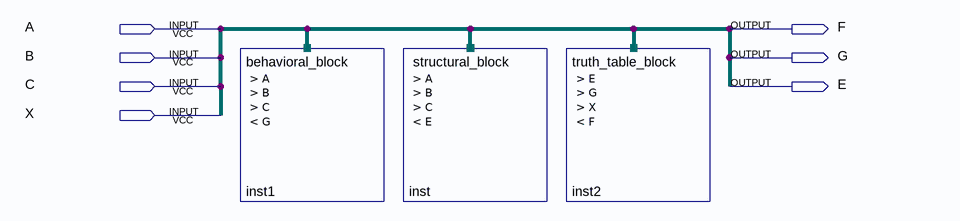
[diagram p0: schematic sheet]
// Quartus schematic lab4_2.bdf as structural Verilog: 3 symbols, 7 pins
module lab4_2 (
  input  A,
  input  B,
  input  C,
  input  X,
  output F,
  output G,
  output E
);

  behavioral_block inst1 (.A(A), .B(B), .C(C), .G(G));
  \_structural_block  inst (.A(A), .B(B), .C(C), .E(E));
  truth_table_block inst2 (.E(E), .G(G), .X(X), .F(F));
endmodule
